# EasyEDA schematic 1-Schematic_New Project.json
TITLE: Sheet_1; REV: 1.0; Date: 2026-10-12; Sheet: 1/1; Drawn By: ahnaafjim; Company: Your Company
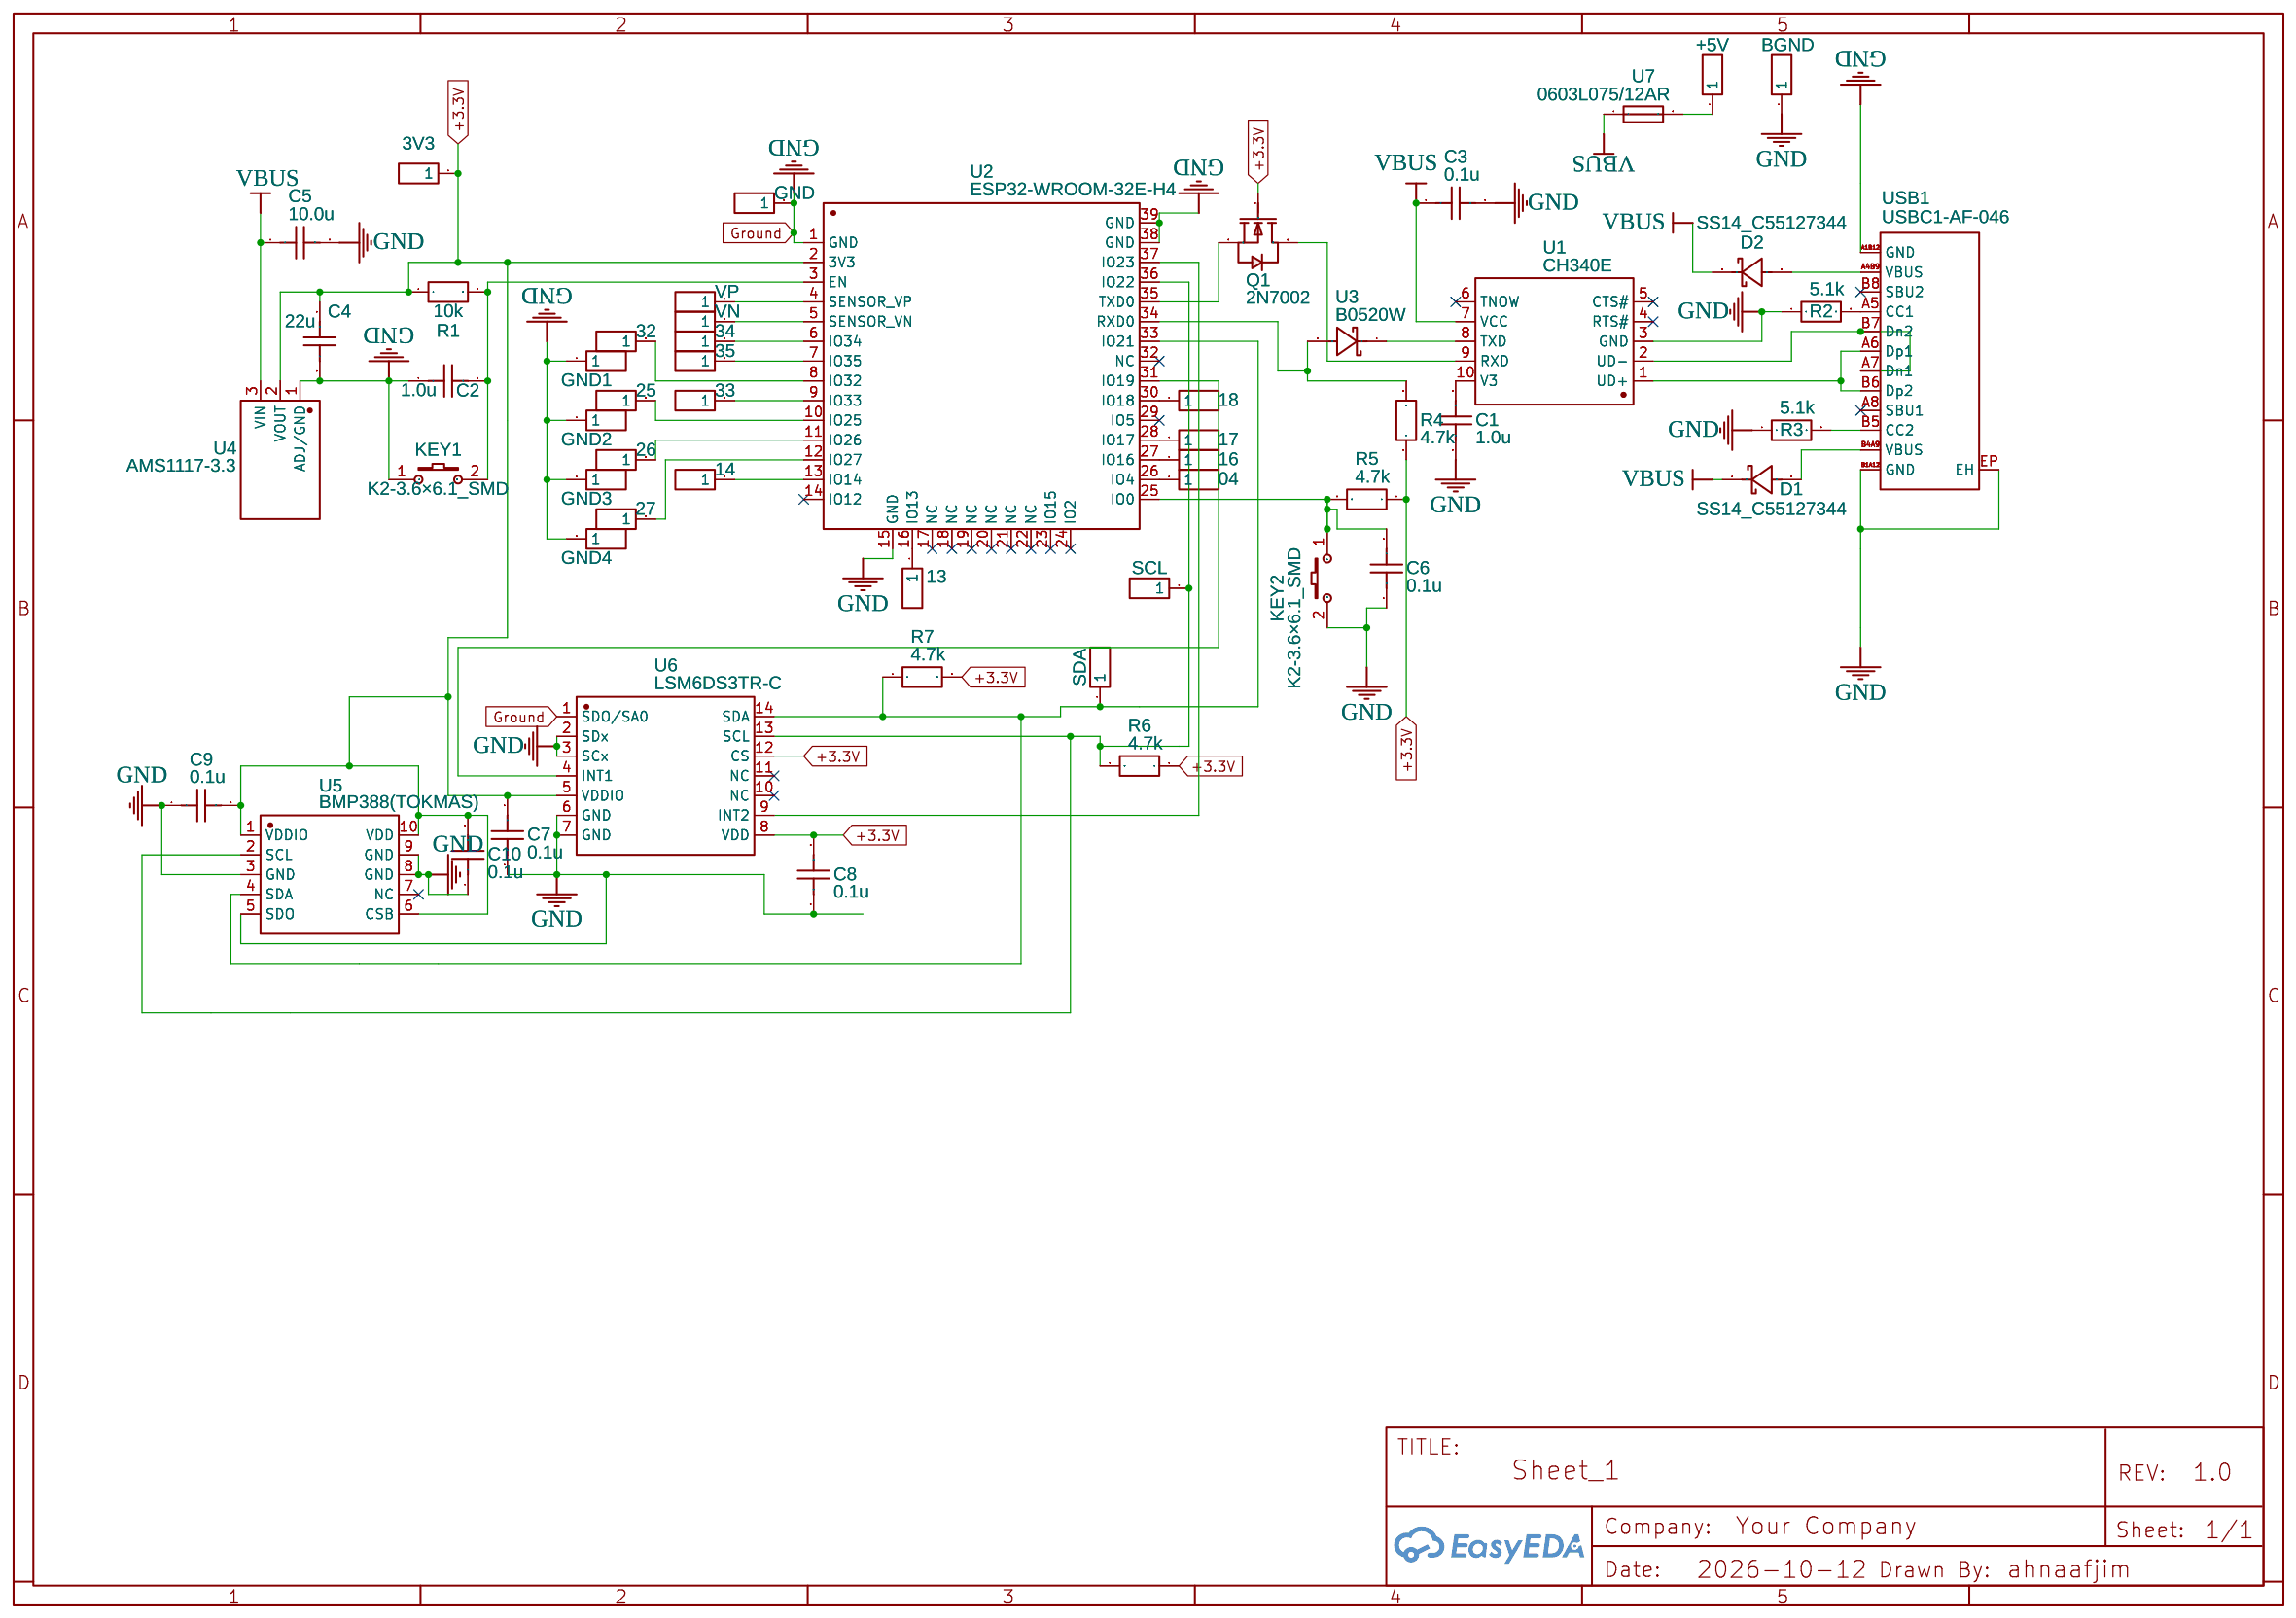
[diagram p0: schematic sheet]

## Parts
3V3  1  [HDR-M-2.54_1X1]
04  1  [HDR-M-2.54_1X1]
13  1  [HDR-M-2.54_1X1]
14  1  [HDR-M-2.54_1X1]
16  1  [HDR-M-2.54_1X1]
17  1  [HDR-M-2.54_1X1]
18  1  [HDR-M-2.54_1X1]
25  1  [HDR-M-2.54_1X1]
26  1  [HDR-M-2.54_1X1]
27  1  [HDR-M-2.54_1X1]
32  1  [HDR-M-2.54_1X1]
33  1  [HDR-M-2.54_1X1]
34  1  [HDR-M-2.54_1X1]
35  1  [HDR-M-2.54_1X1]
+5V  1  [HDR-M-2.54_1X1]
BGND  1  [HDR-M-2.54_1X1]
C1  1.0u  [C0603]
C2  1.0u  [C0603]
C3  0.1u  [C0603]
C4  22u  [C0603]
C5  10.0u  [C0603]
C6  0.1u  [C0603]
C7  0.1u  [C0603]
C8  0.1u  [C0603]
C9  0.1u  [C0603]
C10  0.1u  [C0603]
D1  SS14_C55127344  [SMA_L4.3-W2.6-LS5.0-RD]
D2  SS14_C55127344  [SMA_L4.3-W2.6-LS5.0-RD]
GND  1  [HDR-M-2.54_1X1]
GND1  1  [HDR-M-2.54_1X1]
GND2  1  [HDR-M-2.54_1X1]
GND3  1  [HDR-M-2.54_1X1]
GND4  1  [HDR-M-2.54_1X1]
KEY1  K2-3.6×6.1_SMD  [KEY-SMD_2P-L6.2-W3.6-LS8.0]
KEY2  K2-3.6×6.1_SMD  [KEY-SMD_2P-L6.2-W3.6-LS8.0]
Q1  2N7002  [SOT-23_L2.9-W1.3-P0.95-LS2.4-BR]
R1  10k  [R0603]
R2  5.1k  [R0603]
R3  5.1k  [R0603]
R4  4.7k  [R0603]
R5  4.7k  [R0603]
R6  4.7k  [R0603]
R7  4.7k  [R0603]
SCL  1  [HDR-M-2.54_1X1]
SDA  1  [HDR-M-2.54_1X1]
U1  CH340E  [MSOP-10_L3.0-W3.0-P0.50-LS5.0-BL]
U2  ESP32-WROOM-32E-H4  [WIFI-SMD_ESP32-WROOM-32E]
U3  B0520W  [SOD-123_L2.7-W1.6-LS3.7-RD-1]
U4  AMS1117-3.3  [SOT-89-3_L4.5-W2.5-P1.50-LS4.2-BR]
U5  BMP388(TOKMAS)  [LGA-10_L2.0-W2.0-P0.50-BL]
U6  LSM6DS3TR-C  [LGA-14_L3.0-W2.5-P0.50-TL]
U7  0603L075/12AR  [F0603]
USB1  USBC1-AF-046  [USB-C-SMD_USBC1-AF-046]
VN  1  [HDR-M-2.54_1X1]
VP  1  [HDR-M-2.54_1X1]

## Library data of the parts
3V3 04 13 14 16-18 25-27 32-35 +5V BGND GND GND1-GND4 SCL SDA VN VP = HDR-M-2.54_1x1: Supplier Part: C81276; Supplier: LCSC; Contributor: LCEDA_Lib
C1-C10 = C_0603_US: Contributor: LCEDA_Lib
D1 D2 = SS14_C55127344: Supplier: LCSC; Supplier Part: C55127344; Manufacturer: DongChen(东晨); Manufacturer Part: SS14; JLCPCB Part Class: Extended Part; Contributor: lcsc
KEY1 KEY2 = K2-3.6×6.1_SMD: Supplier Part: C118141; Supplier: LCSC; Manufacturer Part: K2-1107ST-A4SW-06; Contributor: LCEDA_Lib; 制造商: 韩国韩荣
Q1 = 2N7002: Supplier: LCSC; Manufacturer: Nexperia; Manufacturer Part: 2N7002,215; image: //image.lceda.cn/szlcsc/C65189.jpg; Supplier Part: C65189; Paste Type: expand; Contributor: LCEDA_Lib
R1-R7 = R_0603_EU: Contributor: LCEDA_Lib
U1 = CH340E: Supplier: LCSC; Manufacturer: WCH(南京沁恒); Supplier Part: C99652; JLCPCB Part Class: Extended Part
U2 = ESP32-WROOM-32E-H4: Contributor: lcsc; Supplier: LCSC; Supplier Part: C3013935; Manufacturer: ESPRESSIF(乐鑫); JLCPCB Part Class: Extended Part
U3 = B0520W_C5279955: Supplier: LCSC; Supplier Part: C5279955; Manufacturer: JUXING(钜兴); JLCPCB Part Class: Extended Part; Contributor: lcsc
U4 = AMS1117-3.3_C6067465: Supplier: LCSC; Supplier Part: C6067465; Manufacturer: GOODWORK(固得沃克); Contributor: lcsc; JLCPCB Part Class: Extended Part
U5 = BMP388(TOKMAS): Supplier: LCSC; Supplier Part: C54582187; Manufacturer: Tokmas(托克马斯); Contributor: lcsc; JLCPCB Part Class: Extended Part
U6 = LSM6DS3TR-C: Contributor: LCSC; Supplier: LCSC; Supplier Part: C967633; Manufacturer: ST(意法半导体); JLCPCB Part Class: Extended Part; link: https://lcsc.com/eda_search?q=C967633&%26type=1&ref=editor
U7 = 0603L075/12AR: Supplier: LCSC; Supplier Part: C19193028; Manufacturer: LUTE(陆特); Contributor: lcsc; JLCPCB Part Class: Extended Part
USB1 = USBC1-AF-046: Supplier: LCSC; Supplier Part: C50305660; Manufacturer: CHIN-BAN(勤本); JLCPCB Part Class: Extended Part; Contributor: lcsc

## Nets
+3.3V: 3V3.1 C4.2 C7.2 C8.2 C9.2 C10.2 Q1.1(G) R1.1 R4.1 R5.1 R6.1 R7.2 U2.2(3V3) U4.2(VOUT) U5.1(VDDIO) U5.6(CSB) U5.10(VDD) U6.5(VDDIO) U6.8(VDD) U6.12(CS)
GND: BGND.1 C1.1 C2.1 C3.2 C4.1 C5.2 C6.1 C7.1 C8.1 C9.1 C10.1 GND.1 GND1.1 GND2.1 GND3.1 GND4.1 KEY1.1 KEY2.2 R2.1 R3.1 U1.3(GND) U2.1(GND) U2.15(GND) U2.38(GND) U2.39(GND) U4.1(ADJ/GND) U5.3(GND) U5.5(SDO) U5.8(GND) U5.9(GND) U6.1(SDO/SA0) U6.2(SDx) U6.3(SCx) U6.6(GND) U6.7(GND) USB1.A1B12(GND) USB1.B1A12(GND) USB1.EP(EH)
VBUS: C3.1 C5.1 D1.1(C) D2.1(C) U1.7(VCC) U4.3(VIN) U7.1
Net-(04-1): 04.1 U2.26(IO4)
Net-(13-1): 13.1 U2.16(IO13)
Net-(14-1): 14.1 U2.13(IO14)
Net-(16-1): 16.1 U2.27(IO16)
Net-(17-1): 17.1 U2.28(IO17)
Net-(18-1): 18.1 U2.30(IO18)
Net-(25-1): 25.1 U2.10(IO25)
Net-(26-1): 26.1 U2.11(IO26)
Net-(27-1): 27.1 U2.12(IO27)
Net-(32-1): 32.1 U2.8(IO32)
Net-(33-1): 33.1 U2.9(IO33)
Net-(34-1): 34.1 U2.6(IO34)
Net-(35-1): 35.1 U2.7(IO35)
Net-(+5V-1): +5V.1 U7.2
Net-(C1-2): C1.2 U1.10(V3)
Net-(C2-2): C2.2 KEY1.2 R1.2 U2.3(EN)
Net-(C6-2): C6.2 KEY2.1 R5.2 U2.25(IO0)
Net-(D1-2): D1.2(A) USB1.B4A9(VBUS)
Net-(D2-2): D2.2(A) USB1.A4B9(VBUS)
Net-(Q1-2): Q1.2(S) U2.35(TXD0)
Net-(Q1-3): Q1.3(D) U1.9(RXD)
Net-(R2-2): R2.2 USB1.A5(CC1)
Net-(R3-2): R3.2 USB1.B5(CC2)
Net-(R4-2): R4.2 U2.34(RXD0) U3.2(A)
Net-(R6-2): R6.2 SCL.1 U2.36(IO22) U5.2(SCL) U6.13(SCL)
Net-(R7-1): R7.1 SDA.1 U2.33(IO21) U5.4(SDA) U6.14(SDA)
Net-(U1-1): U1.1(UD+) USB1.A6(Dp1) USB1.B6(Dp2)
Net-(U1-2): U1.2(UD-) USB1.A7(Dn1) USB1.B7(Dn2)
Net-(U1-8): U1.8(TXD) U3.1(K)
Net-(U2-4): U2.4(SENSOR_VP) VP.1
Net-(U2-5): U2.5(SENSOR_VN) VN.1
Net-(U2-31): U2.31(IO19) U6.4(INT1)
Net-(U2-37): U2.37(IO23) U6.9(INT2)

Not connected (* = marked no-connect by the designer): U1 4(RTS#)* 5(CTS#)* 6(TNOW)*; U2 14(IO12)* 17(NC)* 18(NC)* 19(NC)* 20(NC)* 21(NC)* 22(NC)* 23(IO15)* 24(IO2)* 29(IO5)* 32(NC)*; U5 7(NC)*; U6 10(NC)* 11(NC)*; USB1 A8(SBU1)* B8(SBU2)*
